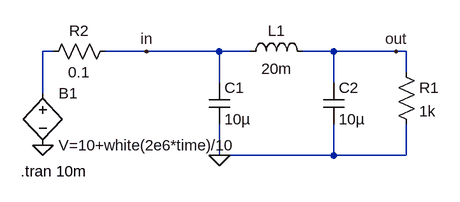
[diagram p0: schematic pi_filter.asc]
pi_filter.asc, the LTspice schematic file:
Version 4
SHEET 1 880 680
WIRE 80 64 64 64
WIRE 224 64 160 64
WIRE 336 64 224 64
WIRE 384 64 336 64
WIRE 512 64 464 64
WIRE 608 64 512 64
WIRE 624 64 608 64
WIRE 624 96 624 64
WIRE 336 112 336 64
WIRE 512 112 512 64
WIRE 64 128 64 64
WIRE 336 224 336 176
WIRE 512 224 512 176
WIRE 512 224 336 224
WIRE 624 224 624 176
WIRE 624 224 512 224
FLAG 64 208 0
FLAG 336 224 0
FLAG 224 64 in
FLAG 608 64 out
SYMBOL bv 64 112 R0
SYMATTR InstName B1
SYMATTR Value V=10+white(2e6*time)/10
SYMBOL cap 320 112 R0
SYMATTR InstName C1
SYMATTR Value 10µ
SYMATTR SpiceLine V=25 Irms=0 Rser=0.001 Lser=0 mfg="TDK" pn="C575OX7RIE106M" type="X7R"
SYMBOL cap 496 112 R0
SYMATTR InstName C2
SYMATTR Value 10µ
SYMATTR SpiceLine V=25 Irms=0 Rser=0.001 Lser=0 mfg="TDK" pn="C575OX7RIE106M" type="X7R"
SYMBOL ind 368 80 R270
WINDOW 0 32 56 VTop 2
WINDOW 3 5 56 VBottom 2
SYMATTR InstName L1
SYMATTR Value 20m
SYMATTR SpiceLine Ipk=1.2 Rser=0.0731 Rpar=188.4 Cpar=0
SYMBOL res 608 80 R0
SYMATTR InstName R1
SYMATTR Value 1k
SYMBOL res 176 48 R90
WINDOW 0 0 56 VBottom 2
WINDOW 3 32 56 VTop 2
SYMATTR InstName R2
SYMATTR Value 0.1
TEXT 30 248 Left 2 !.tran 10m

The netlist it stands for:
* pi_filter.asc
B1 N001 0 V=10+white(2e6*time)/10
C1 in 0 10µ V=25 Irms=0 Rser=0.001 Lser=0 mfg="TDK" pn="C575OX7RIE106M" type="X7R"
C2 out 0 10µ V=25 Irms=0 Rser=0.001 Lser=0 mfg="TDK" pn="C575OX7RIE106M" type="X7R"
L1 in out 20m Ipk=1.2 Rser=0.0731 Rpar=188.4 Cpar=0
R1 out 0 1k
R2 in N001 0.1
.tran 10m
.backanno
.end